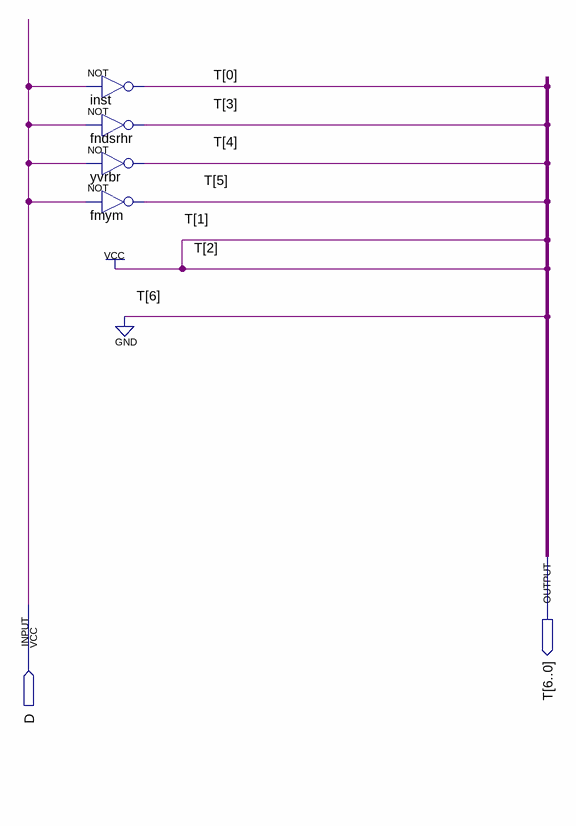
[diagram p0: schematic sheet]
// Quartus schematic DP_T.bdf as structural Verilog: 4 symbols, 2 pins
module DP_T (
  input  D,
  output [6:0] T
);

  not inst (T[0], D);
  not fndsrhr (T[3], D);
  not yvrbr (T[4], D);
  not fmym (T[5], D);

  assign {T[6], T[2:1]} = 3'b011;
endmodule
